# Altium schematic sheet LED_BUK_1.SchDoc
size A; SheetNumber: 1; SheetTotal: 7
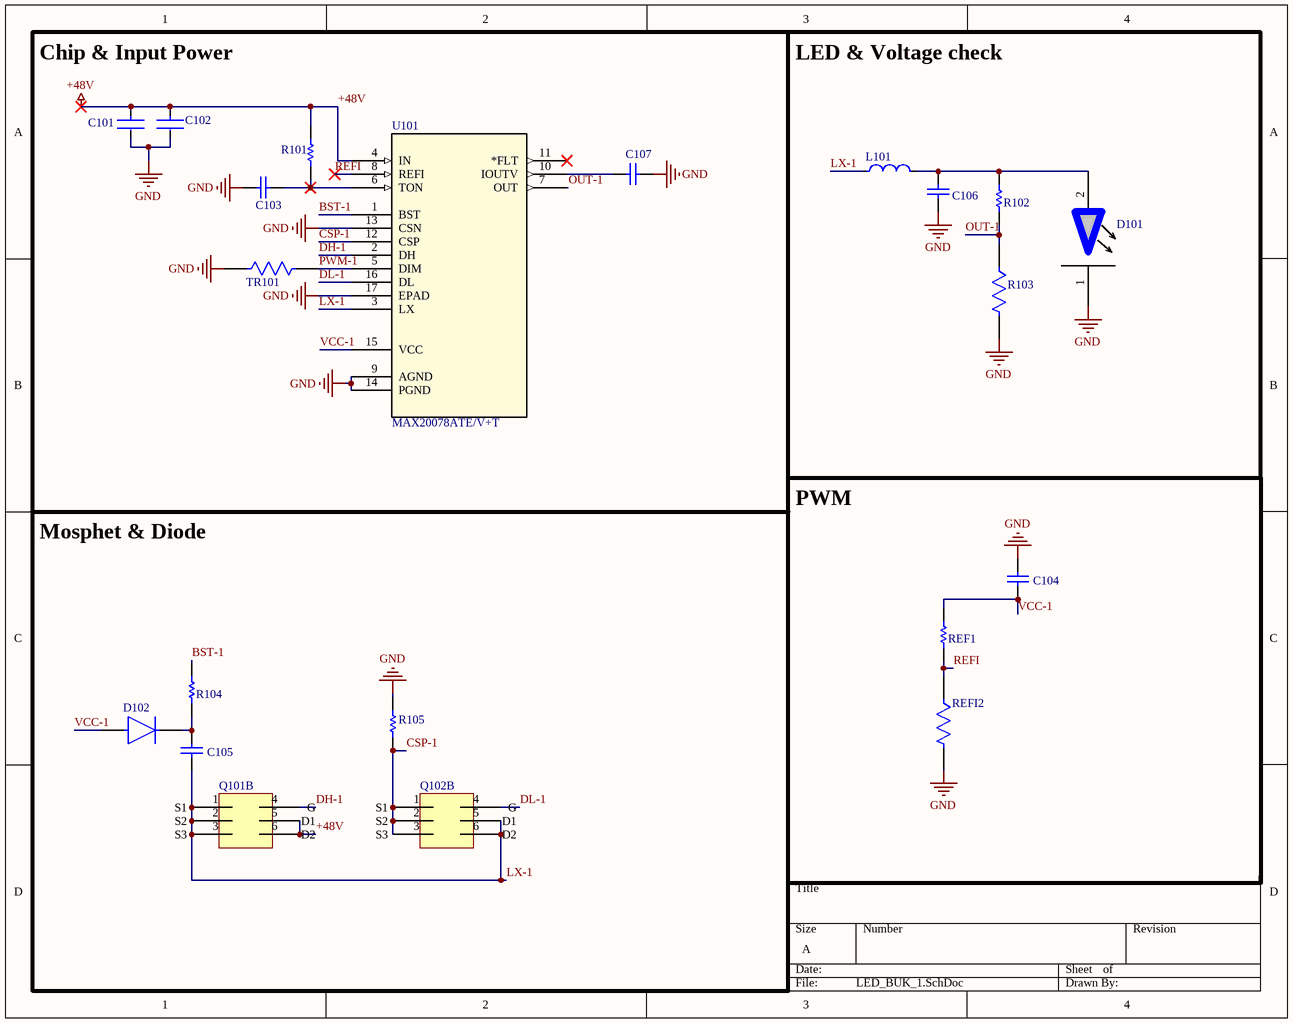
[diagram p0: LED_BUK_1.SchDoc]

## Parts
C101  12101C225KAT2A  [FP-1210-L_3_3_0_4-W_2_5_0-IPC_B]  (value not drawn)
C102  12101C225KAT2A  [FP-1210-L_3_3_0_4-W_2_5_0-IPC_B]  (value not drawn)
C103  GRM1885C1H471JA01D  [C_0603_1608Metric]  (value not drawn)
C104  *AC0805KFX7R7BB225  [C_0805_2012Metric]  (value not drawn)
C105  CL10B224KA8NNNC  [C_0603_1608Metric]  (value not drawn)
C106  CL31B105KCHVPNE  [C_1210_3225Metric]  (value not drawn)
C107  CL31B105KCHVPNE  [C_1210_3225Metric]  (value not drawn)
D101  On back of PCB  [Bridgelux_V22_Custom]  (value not drawn)
D102  B180-13-F  [D_SMA_DO-214AC]  (value not drawn)
L101  YSPI1365-470M  [L_YSPI1365_470M]  (value not drawn)
Q101  custom mosfet  [LFPAK56_SOT669_BUK9Y107]  (value not drawn)  (part B of 2)
Q102  custom mosfet  [LFPAK56_SOT669_BUK9Y107]  (value not drawn)  (part B of 2)
R101  *RC0603FR-0747K5L  [R_0603_1608Metric]  (value not drawn)
R102  RC0603FR-07324KL  [RESC1608X55X25NL10T15]  (value not drawn)
R103  RC0603FR-0724K9L  [FP-RC_L0603-MFG]  (value not drawn)
R104  4R7 1% 0603(1608)  [RESC0603(1608)_M]  (value not drawn)
R105  FRM121WFR100TM  [R_1206_3216Metric]  (value not drawn)
REF1  ERJ-3EKF3162V  [RESC1608X55X30NL15T15]  (value not drawn)
REFI2  RC0603FR-0710KL  [FP-RC0603-0_55-IPC_C]  (value not drawn)
TR101  RC0603FR-0710KL  [FP-RC0603-0_55-IPC_C]  (value not drawn)
U101  MAX20078ATE/V+T  [21-0136V_T1633+4C_MXM]

## Nets
+48V: C101.1 C102.1 Q101.5(D1) Q101.6(D2) R101.1 U101.4(IN)
GND: C101.2 C102.2 C103.1 C104.1 C106.2 C107.2 D101.1 R103.2 R105.1 REFI2.2 TR101.1 U101.9(AGND) U101.13(CSN) U101.14(PGND) U101.17(EPAD)
BST-1: R104.2 U101.1(BST)
CSP-1: Q102.1(S1) Q102.2(S2) Q102.3(S3) R105.2 U101.12(CSP)
DH-1: Q101.4(G) U101.2(DH)
DL-1: Q102.4(G) U101.16(DL)
LX-1: C105.2 L101.1 Q101.1(S1) Q101.2(S2) Q101.3(S3) Q102.5(D1) Q102.6(D2) U101.3(LX)
OUT-1: R102.2 R103.1 U101.7(OUT)
PWM-1: TR101.2 U101.5(DIM)
REFI: REF1.2 REFI2.1 U101.8(REFI)
VCC-1: C104.2 D102.2(A) REF1.1 U101.15(VCC)
NetC103_2: C103.2 R101.2 U101.6(TON)
NetC105_1: C105.1 D102.1(C) R104.1
NetC106_1: C106.1 D101.2 L101.2 R102.1
NetC107_1: C107.1 U101.10(IOUTV)

Not connected (* = marked no-connect by the designer): U101 11(*FLT)*

## Notes on the sheet
- Chip & Input Power
- LED & Voltage check
- PWM
- Mosphet & Diode

## Library data of the parts
C101 C102 = CMP-1038-02104-3: General Purpose Ceramic Capacitor, 1210, 2.2uF, 10%, X7R, 15%, 100V; Dissipation Factor: 2.5%; Number of Pins: 2; Lead Free: Lead Free; Voltage Rating: 100V; Min Operating Temperature: -55°C; Height: 2.79mm; Length: 3.2mm; Capacitance: 2.2uF; RoHS Compliant: Yes; Case/Package: 1210; Max Operating Temperature: 125°C; Radiation Hardening: No; Series: -; Case Code (Metric): 3225; Dielectric: X7R; Voltage Rating (DC): 100V; Packaging: Tape and Reel; Width: 2.5mm; Thickness: 0.11inch; Depth: 2.5mm; Contact Plating: Tin; REACH SVHC: No SVHC; Tolerance: 10%; Construction: Flat; Case Code (Imperial): 1210; Mount: Surface Mount; Package Quantity: 1; Termination: SMD/SMT; Voltage: 100V; LCSC Part #: C2168116
C103 = GRM1885C1H471JA01D: 470 pF, 50 V, C0G, 0603; LCSC Part #: C85979; Supplier 1: Avnet; Supplier Part Number 1: GRM1885C1H471JA01D
C104 = AC0805KFX7R7BB225: 2.2 µF, 16 V, X7R, 0805; Supplier 1: Avnet; Supplier Part Number 1: AC0805KFX7R7BB225; LCSC Part #: C20143097
C105 = CL10B224KA8NNNC: 0.22 µF, 25 V, X7R, 0603; Supplier 1: Future Electronics; Supplier Part Number 1: CL10B224KA8NNNC; LCSC Part #: C21120
C106 C107 = CL31B105KCHVPNE: 1 µF, 100 V DC, 1206 (3216 metric); Supplier 1: Mouser; Supplier Part Number 1: 187-CL31B105KCHVPNE; LCSC Part #: C307368
D101 = Bridgelux_V22_Custom
D102 = B180-13-F: Schottky diode, SMA; Supplier 1: Newark; Supplier Part Number 1: B180-13-F; LCSC Part #: C155354
L101 = CompoYSPI1365-470Mnent_1: 47 µH inductor; LCSC Part #: C497913
Q101 Q102 = BUK9Y107-80EX: 80 V N-channel MOSFET; LSCS Part #: C503620; Supplier 1: Arrow Electronics; Supplier Part Number 1: BUK9Y107-80EX
R101 = RC0603FR-0747K5L: 47.5 kΩ; Supplier 1: Newark; Supplier Part Number 1: RC0603FR-0747K5L; LCSC Part #: C137715
R102 = CMP-2000-04009-1: Manufacturer: Yageo; Part Number: RC0603FR-07324KL; LCSC Part #: C273758
R103 = CMP-03412-013083-1: RES SMD 24.9K OHM 1% 1/10W 0603; Manufacturer: Yageo; Approved Alternate Part Number: 541-1.00HHCT-ND; Voltage Rating: 75V; Power Rating: 0.1W; Resistance: 24.9kΩ; Value: 24.9kΩ; Power: 100mW; Temperature Coefficient: 100ppm/°C; Footprint Url: https://www.yageo.com/upload/website/yageo_PYu-R_Mount_10_19050818_343.pdf; Automotive: No; Temperature Range Low: -55°C; Manufacturer Part Number: RC0603FR-0724K9L; Ipc Land Pattern Name: RESC16080X45; Digikey Description: RES SMD 24.9K OHM 1% 1/10W 0603; Voltage: 75V; Composition: Thick Film; Device Class L1: Passive Components; Device Class L2: Resistors; Device Class L3: Chip SMD Resistors; ComponentLink2URL: https://www.yageo.com/upload/media/product/productsearch/datasheet/rchip/PYu-RC_Group_51_RoHS_L_10.pdf; Series: RC_L; Octopart: https://octopart.com/rc0603fr-0724k9l-yageo-1189838; RoHS: TRUE; Category: Res; Height: 0.55mm; Tolerance: 1%; Temperature: -55°C to +155°C; Temperature Range High: +155°C; ComponentLink2Description: Datasheet; Package: RC_L0603; Lead Free: Yes; Mouser Description: Res Thick Film 1.6 x 0.8 mm 24.9K Ohm 1% 0.1W(1/10W) 100ppm/ C Molded SMD Paper T/R; LCSC Part #: C137761
R104 = CMP-1012-00247-1: 4R7 0.1W 1% 0603 (1608 Metric)  SMD; Case-EIA: 0603; Case-Metric: 1608; Value: 4.70 Ohm; Power: 0.1 W; Technology: SMT; Tolerance: 1 %; LCSC Part #: C137705
R105 = FRM121WFR100TM: 0.1 Ω, 1 W, 1206; LCSC Part #: C7467250
REF1 = CMP-2000-00428-1: Manufacturer: Panasonic; Part Number: ERJ-3EKF3162V; LCSC Part #: C403154
REFI2 TR101 = CMP-2100-03664-2: RES 10K OHM 1% 1/10W 0603; Voltage Rating: 75V; Voltage Rating (DC): 50V; Resistance: 10kR; Power Rating: 100mW; Temperature Coefficient: 100ppm/°C; Depth: 0.8mm; Termination: SMD/SMT; Resistor Type: Thick Film; Series: RC; Construction: Rectangular; Features: Moisture Resistant; Packaging: Tape and Reel; Min Operating Temperature: -55°C; Number of Terminations: 2; Lead Pitch: 0.3mm; RoHS Compliant: Yes; Case/Package: 0603; Resistance Tolerance: 1%; Military Standard: Not; Weight: 7.1E-05oz; Number of Pins: 2; Tolerance: 1%; Length: 1.6mm; Case Code (Imperial): 0603; Lead Free: Lead Free; Width: 0.8mm; Max Power Dissipation: 100mW; Height: 0.45mm; Max Operating Temperature: 155°C; Case Code (Metric): 1608; Size Code: 0603; LCSC Part #: C98220
U101 = MAX20078ATEV+T: Synchronous Buck, High-Brightness LED Controller; Manufacturer_Name: Analog Devices Inc; LSCS Part #: C2679249; Copyright: Copyright (C) 2026 Ultra Librarian. All rights reserved.; Manufacturer_Part_Number: MAX20078ATE/V+T; RefDes: RefDes; Type: Type; Supplier 1: Mouser; Supplier Part Number 1: 700-MAX20078ATE/V+T